# Altium schematic sheet 48V-12V20A.SchDoc
size 420 x 297 mm; SheetNumber: 1; SheetTotal: 1
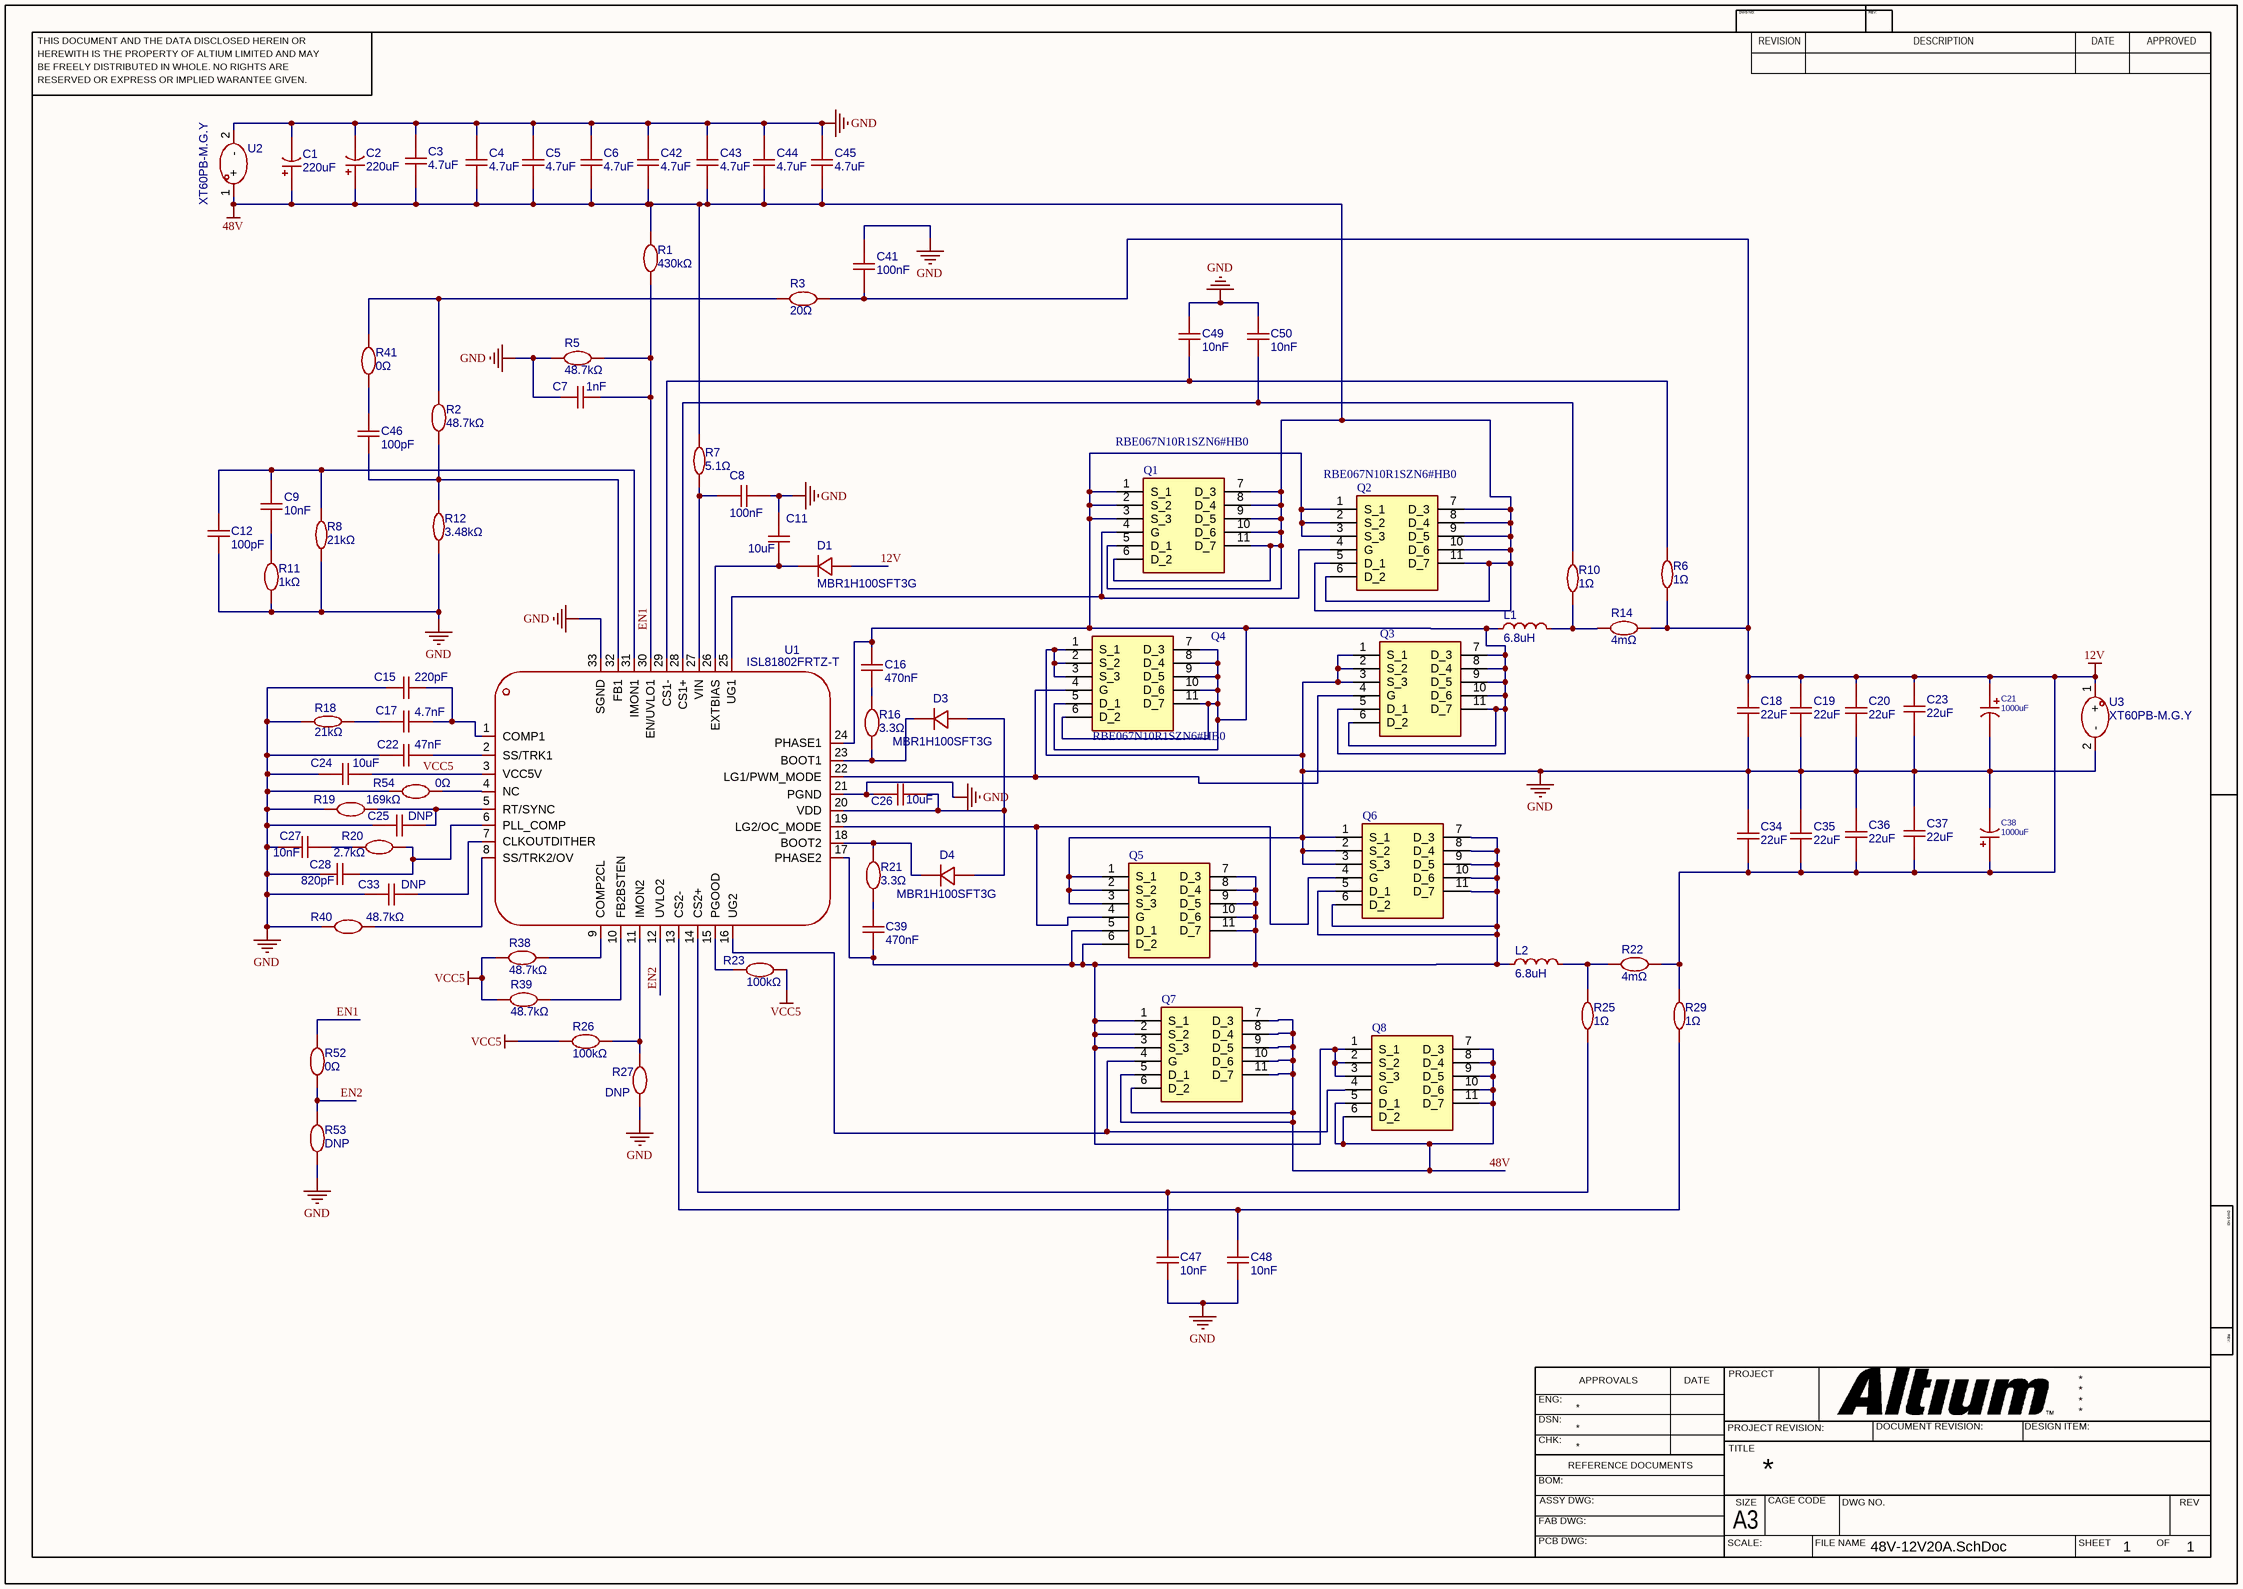
[diagram p0: 48V-12V20A.SchDoc]

## Parts
C1  220uF  [CAP-TH_BD12.5-P5.00-D0.6-FD]
C2  220uF  [CAP-TH_BD12.5-P5.00-D0.6-FD]
C3  4.7uF  [C1210]
C4  4.7uF  [C1210]
C5  4.7uF  [C1210]
C6  4.7uF  [C1210]
C7  1nF  [C0603]
C8  100nF  [C0402]
C9  10nF  [C0805]
C11  10uF  [C0805]
C12  100pF  [C0603]
C15  220pF  [C0402]
C16  470nF  [C0603]
C17  4.7nF  [C0402]
C18  22uF  [C1210]
C19  22uF  [C1210]
C20  22uF  [C1210]
C21  1000uF  [CAP-TH_BD8.0-P3.50-D0.6-FD-H17.0]
C22  47nF  [C0603]
C23  22uF  [C1210]
C24  10uF  [C1210]
C25  DNP  [C0603]
C26  10uF  [C0805]
C27  10nF  [C0805]
C28  820pF  [C0603]
C33  DNP  [C0603]
C34  22uF  [C1210]
C35  22uF  [C1210]
C36  22uF  [C1210]
C37  22uF  [C1210]
C38  1000uF  [CAP-TH_BD8.0-P3.50-D0.6-FD-H17.0]
C39  470nF  [C0603]
C41  100nF  [C0603]
C42  4.7uF  [C1210]
C43  4.7uF  [C1210]
C44  4.7uF  [C1210]
C45  4.7uF  [C1210]
C46  100pF  [C0603]
C47  10nF  [C0805]
C48  10nF  [C0805]
C49  10nF  [C0805]
C50  10nF  [C0805]
D1  MBR1H100SFT3G  [SOD-123F_L2.8-W1.8-LS3.7-RD]
D3  MBR1H100SFT3G  [SOD-123F_L2.8-W1.8-LS3.7-RD]
D4  MBR1H100SFT3G  [SOD-123F_L2.8-W1.8-LS3.7-RD]
L1  6.8uH  [IND-SMD_L12.8-W12.8-LS13.8_CYA1265]
L2  6.8uH  [IND-SMD_L12.8-W12.8-LS13.8_CYA1265]
Q1  RBE067N10R1SZN6#HB0  [RBA80N10EANS4UA07]
Q2  RBE067N10R1SZN6#HB0  [RBA80N10EANS4UA07]
Q3  RBE067N10R1SZN6#HB0  [RBA80N10EANS4UA07]  (value not drawn)
Q4  RBE067N10R1SZN6#HB0  [RBA80N10EANS4UA07]
Q5  RBE067N10R1SZN6#HB0  [RBA80N10EANS4UA07]  (value not drawn)
Q6  RBE067N10R1SZN6#HB0  [RBA80N10EANS4UA07]  (value not drawn)
Q7  RBE067N10R1SZN6#HB0  [RBA80N10EANS4UA07]  (value not drawn)
Q8  RBE067N10R1SZN6#HB0  [RBA80N10EANS4UA07]  (value not drawn)
R1  430kΩ  [R1206]
R2  48.7kΩ  [R0603]
R3  20Ω  [R0603]
R5  48.7kΩ  [R0603]
R6  1Ω  [R0603]
R7  5.1Ω  [R0603]
R8  21kΩ  [R0603]
R10  1Ω  [R0603]
R11  1kΩ  [R0603]
R12  3.48kΩ  [R0603]
R14  4mΩ  [RES-SMD_L6.4-W3.2_RLP25]
R16  3.3Ω  [R0603]
R18  21kΩ  [R0603]
R19  169kΩ  [R0603]
R20  2.7kΩ  [R0603]
R21  3.3Ω  [R0603]
R22  4mΩ  [RES-SMD_L6.4-W3.2_RLP25]
R23  100kΩ  [R0603]
R25  1Ω  [R0603]
R26  100kΩ  [R0603]
R27  DNP  [R0603]
R29  1Ω  [R0603]
R38  48.7kΩ  [R0603]
R39  48.7kΩ  [R0603]
R40  48.7kΩ  [R0603]
R41  0Ω  [R0402]
R52  0Ω  [R0402]
R53  DNP  [R0402]
R54  0Ω  [R0402]
U1  ISL81802FRTZ-T  [TQFN-32_L5.0-W5.0-P0.50-TL-EP3.5]
U2  XT60PB-M.G.Y  [CONN-TH_XT60PB-M]
U3  XT60PB-M.G.Y  [CONN-TH_XT60PB-M]

## Nets
12V: C18.2 C19.2 C20.2 C21.1 C23.2 C34.1 C35.1 C36.1 C37.1 C38.1 C41.1 D1.2(A) R3.2 R6.1 R14.2 R22.2 R29.2 U3.1(+)
48V: C1.1 C2.1 C3.1 C4.1 C5.1 C6.1 C42.1 C43.1 C44.1 C45.1 Q1.5(D_1) Q1.6(D_2) Q1.7(D_3) Q1.8(D_4) Q1.9(D_5) Q1.10(D_6) Q1.11(D_7) Q2.5(D_1) Q2.6(D_2) Q2.7(D_3) Q2.8(D_4) Q2.9(D_5) Q2.10(D_6) Q2.11(D_7) Q7.5(D_1) Q7.6(D_2) Q7.7(D_3) Q7.8(D_4) Q7.9(D_5) Q7.10(D_6) Q7.11(D_7) Q8.5(D_1) Q8.6(D_2) Q8.7(D_3) Q8.8(D_4) Q8.9(D_5) Q8.10(D_6) Q8.11(D_7) R1.2 R7.2 U2.1(+)
GND: C1.2 C2.2 C3.2 C4.2 C5.2 C6.2 C7.1 C8.2 C11.2 C12.1 C15.1 C18.1 C19.1 C20.1 C21.2 C22.2 C23.1 C24.1 C25.1 C26.2 C27.1 C28.1 C33.1 C34.2 C35.2 C36.2 C37.2 C38.2 C41.2 C42.2 C43.2 C44.2 C45.2 C47.1 C48.1 C49.2 C50.2 Q3.1(S_1) Q3.2(S_2) Q3.3(S_3) Q4.1(S_1) Q4.2(S_2) Q4.3(S_3) Q5.1(S_1) Q5.2(S_2) Q5.3(S_3) Q6.1(S_1) Q6.2(S_2) Q6.3(S_3) R5.1 R8.1 R11.1 R12.1 R18.1 R19.1 R27.2 R40.1 R53.1 R54.1 U1.21(PGND) U1.33(SGND) U2.2(-) U3.2(-)
VCC5: C24.2 R23.2 R26.1 R38.1 R39.1 U1.3(VCC5V)
EN1: C7.2 R1.1 R5.2 R52.2 U1.30(EN/UVLO1)
EN2: R52.1 R53.2 U1.12(UVLO2)
NetC8_1: C8.1 R7.1 U1.27(VIN)
NetC9_1: C9.1 R11.2
NetC9_2: C9.2 C12.2 R8.2 U1.31(IMON1)
NetC11_1: C11.1 D1.1(C) U1.26(EXTBIAS)
NetC15_2: C15.2 C17.2 U1.1(COMP1)
NetC16_1: C16.1 R16.2
NetC16_2: C16.2 L1.1 Q1.1(S_1) Q1.2(S_2) Q1.3(S_3) Q2.1(S_1) Q2.2(S_2) Q2.3(S_3) Q3.5(D_1) Q3.6(D_2) Q3.7(D_3) Q3.8(D_4) Q3.9(D_5) Q3.10(D_6) Q3.11(D_7) Q4.5(D_1) Q4.6(D_2) Q4.7(D_3) Q4.8(D_4) Q4.9(D_5) Q4.10(D_6) Q4.11(D_7) U1.24(PHASE1)
NetC17_1: C17.1 R18.2
NetC22_1: C22.1 U1.2(SS/TRK1)
NetC25_2: C25.2 R19.2 U1.5(RT/SYNC)
NetC26_1: C26.1 D3.2(A) D4.2(A) U1.20(VDD)
NetC27_2: C27.2 R20.1
NetC28_2: C28.2 R20.2 U1.6(PLL_COMP)
NetC33_2: C33.2 U1.7(CLKOUTDITHER)
NetC39_1: C39.1 L2.1 Q5.5(D_1) Q5.6(D_2) Q5.7(D_3) Q5.8(D_4) Q5.9(D_5) Q5.10(D_6) Q5.11(D_7) Q6.5(D_1) Q6.6(D_2) Q6.7(D_3) Q6.8(D_4) Q6.9(D_5) Q6.10(D_6) Q6.11(D_7) Q7.1(S_1) Q7.2(S_2) Q7.3(S_3) Q8.1(S_1) Q8.2(S_2) Q8.3(S_3) U1.17(PHASE2)
NetC39_2: C39.2 R21.1
NetC46_1: C46.1 R2.1 R12.2 U1.32(FB1)
NetC46_2: C46.2 R41.1
NetC47_2: C47.2 R25.1 U1.14(CS2+)
NetC48_2: C48.2 R29.1 U1.13(CS2-)
NetC49_1: C49.1 R6.2 U1.29(CS1-)
NetC50_1: C50.1 R10.2 U1.28(CS1+)
NetD3_1: D3.1(C) R16.1 U1.23(BOOT1)
NetD4_1: D4.1(C) R21.2 U1.18(BOOT2)
NetL1_2: L1.2 R10.1 R14.1
NetL2_2: L2.2 R22.1 R25.2
NetQ1_4: Q1.4(G) Q2.4(G) U1.25(UG1)
NetQ3_4: Q3.4(G) Q4.4(G) U1.22(LG1/PWM_MODE)
NetQ5_4: Q5.4(G) Q6.4(G) U1.19(LG2/OC_MODE)
NetQ7_4: Q7.4(G) Q8.4(G) U1.16(UG2)
NetR2_2: R2.2 R3.1 R41.2
NetR23_1: R23.1 U1.15(PGOOD)
NetR26_2: R26.2 R27.1 U1.11(IMON2)
NetR38_2: R38.2 U1.9(COMP2CL)
NetR39_2: R39.2 U1.10(FB2BSTEN)
NetR40_2: R40.2 U1.8(SS/TRK2/OV)
NetR54_2: R54.2 U1.4(NC)

## Notes on the sheet
- THIS DOCUMENT AND THE DATA DISCLOSED HEREIN OR
- HEREWITH IS THE PROPERTY OF ALTIUM LIMITED AND MAY
- DWG NO:
- REVISION
- REV:
- DESCRIPTION
- DATE
- APPROVED
- BE FREELY DISTRIBUTED IN WHOLE. NO RIGHTS ARE
- RESERVED OR EXPRESS OR IMPLIED WARANTEE GIVEN.
- ENG:
- APPROVALS
- PROJECT
- DSN:
- CHK:
- REFERENCE DOCUMENTS
- PROJECT REVISION:
- TITLE
- DOCUMENT REVISION:
- DESIGN ITEM:
- BOM:
- FAB DWG:
- PCB DWG:
- ASSY DWG:
- SCALE:
- A3
- SIZE
- CAGE CODE
- FILE NAME
- DWG NO.
- SHEET
- OF
- REV

## Library data of the parts
C1 C2 = EKZN101ELL221MK25S: 容值:220uF;精度:±20%;额定电压:100V;纹波电流:1.105A@120Hz;等效串联电阻(ESR):-;; Manufacturer: NCC(日本贵弥功); AddInBom: yes; ModelId: 968d8ff988964aab8919b46a6a737be2聨0819f05c4eef4c71ace90d822a990e87; ModelName: CAP-TH_D12.5-H20.0-P5.00; ModelTransform: 492.5187,492.11201,0,0,0,0,0,0,-137.795; Tolerance: ±20%; Voltage Rating: 100V; Pin Spacing: 5mm; Lifetime: 10000hrs@105℃; Symbol: EKZN101ELL221MK25S; Device: EKZN101ELL221MK25S; LCSC Part Name: 220uF ±20% 100V; SupplierPart: C2998532; ManufacturerPart: EKZN101ELL221MK25S; Supplier Footprint: 插件,D12.5xL25mm; JLCPCB Part Class: Extended Part; Datasheet: https://item.szlcsc.com/datasheet/EKZN101ELL221MK25S/3472715.html; Supplier: LCSC; ConvertToPcb: yes; FootprintName: CAP-TH_BD12.5-P5.00-D0.6-FD; Value: 220uF; Ripple Current: 1.105A@120Hz; Equivalent Series Resistance(ESR): -; Diameter: 12.5mm; Height - Seated (Max): 25mm; Operating Temperature: -40℃~+105℃
C3-C6 C42-C45 = GCM32DC72A475KE02L: 容值:4.7uF;精度:±10%;额定电压:100V;温度系数:X7S;; Manufacturer: muRata(村田); AddInBom: yes; ModelId: 833068e7fe044595a6eec77c56179455聨0819f05c4eef4c71ace90d822a990e87; ModelName: C1210_L3.2-W2.5-H2.5; ModelTransform: 125.984,98.425,0,0,0,0,0,0,0; Tolerance: ±10%; Voltage Rating: 100V; Temperature Coefficient: X7S; Symbol: GCM32DC72A475KE02L; Device: GCM32DC72A475KE02L; LCSC Part Name: 4.7uF ±10% 100V; SupplierPart: C913445; ManufacturerPart: GCM32DC72A475KE02L; Supplier Footprint: 1210; JLCPCB Part Class: Extended Part; Datasheet: https://item.szlcsc.com/datasheet/GCM32DC72A475KE02L/983764.html; Supplier: LCSC; ConvertToPcb: yes; FootprintName: C1210; Value: 4.7uF
C7 = CC0603KRX7R9BB102: 容值:1nF;精度:±10%;额定电压:50V;材质(温度系数):X7R;; Manufacturer: YAGEO(国巨); AddInBom: yes; ModelId: ac125912035d415993ca9572d50418b1聨0819f05c4eef4c71ace90d822a990e87; ModelName: C0603_L1.6-W0.8-H0.8; ModelTransform: 62.992,31.496,0,0,0,0,0,0,0; Tolerance: ±10%; Voltage Rated: 50V; Temperature Coefficient: X7R; Symbol: CC0603KRX7R9BB102; Device: CC0603KRX7R9BB102; LCSC Part Name: 1nF ±10% 50V; SupplierPart: C100040; ManufacturerPart: CC0603KRX7R9BB102; Supplier Footprint: 0603; JLCPCB Part Class: Extended Part; Datasheet: https://atta.szlcsc.com/upload/public/pdf/source/20180910/C282072_33301C7F631E79921B82A8DAC6BCC5B3.pdf; Supplier: LCSC; ConvertToPcb: yes; FootprintName: C0603; Value: 1nF
C8 = CGA0402X5R104K101GT: 容值:100nF;精度:±10%;额定电压:100V;温度系数:X5R;; Manufacturer: HRE(芯声); AddInBom: yes; ModelId: 36a51122f27c49738f86b3bfa98863e0聨0819f05c4eef4c71ace90d822a990e87; ModelName: C0402_L1.0-W0.5-H0.5; ModelTransform: 39.37,19.685,0,0,0,0,0,0,0; Tolerance: ±10%; Voltage Rating: 100V; Temperature Coefficient: X5R; Symbol: CGA0402X5R104K101GT; Device: CGA0402X5R104K101GT; LCSC Part Name: 100nF ±10% 100V; SupplierPart: C49056139; ManufacturerPart: CGA0402X5R104K101GT; Supplier Footprint: 0402; JLCPCB Part Class: Extended Part; Datasheet: https://item.szlcsc.com/datasheet/CGA0402X5R104K101GT/51423913.html; Supplier: LCSC; ConvertToPcb: yes; FootprintName: C0402; Value: 100nF
C9 C27 = GRM2195C1H103FA01D: 容值:10nF;精度:±1%;额定电压:50V;材质(温度系数):C0G;; Manufacturer: muRata(村田); AddInBom: yes; ModelId: 1ba041120af144c991958decab20d241聨0819f05c4eef4c71ace90d822a990e87; ModelName: C0805_L2.0-W1.3-H1.3; ModelTransform: 78.74,51.181,0,0,0,0,0,0.0005,0; Tolerance: ±1%; Voltage Rated: 50V; Temperature Coefficient: C0G; Symbol: GRM2195C1H103FA01D; Device: GRM2195C1H103FA01D; LCSC Part Name: 10nF ±1% 50V; SupplierPart: C441760; ManufacturerPart: GRM2195C1H103FA01D; Supplier Footprint: 0805; JLCPCB Part Class: Extended Part; Datasheet: https://atta.szlcsc.com/upload/public/pdf/source/20200305/C490387_23319AE8C154DEB24C505E6C82A8106A.pdf; Supplier: LCSC; ConvertToPcb: yes; FootprintName: C0805; Value: 10nF
C11 = HGC0805R5106K500NSLJ: 容值:10uF;精度:±10%;额定电压:50V;温度系数:X5R;; Manufacturer: Chinocera(华瓷); AddInBom: yes; ModelId: 1ba041120af144c991958decab20d241聨0819f05c4eef4c71ace90d822a990e87; ModelName: C0805_L2.0-W1.3-H1.3; ModelTransform: 78.74,51.181,0,0,0,0,0,0.0005,0; Tolerance: ±10%; Voltage Rating: 50V; Temperature Coefficient: X5R; Symbol: HGC0805R5106K500NSLJ; Device: HGC0805R5106K500NSLJ; LCSC Part Name: 10uF ±10% 50V; SupplierPart: C22367830; ManufacturerPart: HGC0805R5106K500NSLJ; Supplier Footprint: 0805; JLCPCB Part Class: Extended Part; Datasheet: https://item.szlcsc.com/datasheet/HGC0805R5106K500NSLJ/23841135.html; Supplier: LCSC; ConvertToPcb: yes; FootprintName: C0805; Value: 10uF
C12 C46 = CC0603JRNPO0BN101: 容值:100pF;精度:±5%;额定电压:100V;温度系数:NP0;; Manufacturer: YAGEO(国巨); AddInBom: yes; ModelId: ac125912035d415993ca9572d50418b1聨0819f05c4eef4c71ace90d822a990e87; ModelName: C0603_L1.6-W0.8-H0.8; ModelTransform: 62.992,31.496,0,0,0,0,0,0,0; Tolerance: ±5%; Voltage Rating: 100V; Temperature Coefficient: NP0; Symbol: CC0603JRNPO0BN101; Device: CC0603JRNPO0BN101; LCSC Part Name: 100pF ±5% 100V; SupplierPart: C107033; ManufacturerPart: CC0603JRNPO0BN101; Supplier Footprint: 0603; JLCPCB Part Class: Extended Part; Datasheet: https://item.szlcsc.com/datasheet/CC0603JRNPO0BN101/108249.html; Supplier: LCSC; ConvertToPcb: yes; FootprintName: C0603; Value: 100pF
C15 = 0402B221K500NT: 容值:220pF;精度:±10%;额定电压:50V;温度系数:X7R;; Manufacturer: FH(风华); AddInBom: yes; ModelId: 36a51122f27c49738f86b3bfa98863e0聨0819f05c4eef4c71ace90d822a990e87; ModelName: C0402_L1.0-W0.5-H0.5; ModelTransform: 39.37,19.685,0,0,0,0,0,0,0; Tolerance: ±10%; Voltage Rating: 50V; Temperature Coefficient: X7R; Symbol: 0402B221K500NT; Device: 0402B221K500NT; LCSC Part Name: 220pF ±10% 50V; SupplierPart: C1530; ManufacturerPart: 0402B221K500NT; Supplier Footprint: 0402; JLCPCB Part Class: Basic Part; Datasheet: https://item.szlcsc.com/datasheet/0402B221K500NT/1882.html; Supplier: LCSC; ConvertToPcb: yes; FootprintName: C0402; Value: 220pF
C16 C39 = GRM188R71E474KA12D: 容值:470nF;精度:±10%;额定电压:25V;温度系数:X7R;; Manufacturer: muRata(村田); AddInBom: yes; ModelId: ac125912035d415993ca9572d50418b1聨0819f05c4eef4c71ace90d822a990e87; ModelName: C0603_L1.6-W0.8-H0.8; ModelTransform: 62.992,31.496,0,0,0,0,0,0,0; Tolerance: ±10%; Voltage Rating: 25V; Temperature Coefficient: X7R; Symbol: GRM188R71E474KA12D; Device: GRM188R71E474KA12D; LCSC Part Name: 470nF ±10% 25V; SupplierPart: C77052; ManufacturerPart: GRM188R71E474KA12D; Supplier Footprint: 0603; JLCPCB Part Class: Extended Part; Datasheet: https://item.szlcsc.com/datasheet/GRM188R71E474KA12D/78179.html; Supplier: LCSC; ConvertToPcb: yes; FootprintName: C0603; Value: 470nF
C17 = GRM1555C1H472JE01D: 容值:4.7nF;精度:±5%;额定电压:50V;温度系数:C0G;; Manufacturer: muRata(村田); AddInBom: yes; ModelId: 36a51122f27c49738f86b3bfa98863e0聨0819f05c4eef4c71ace90d822a990e87; ModelName: C0402_L1.0-W0.5-H0.5; ModelTransform: 39.37,19.685,0,0,0,0,0,0,0; Tolerance: ±5%; Voltage Rating: 50V; Temperature Coefficient: C0G; Symbol: GRM1555C1H472JE01D; Device: GRM1555C1H472JE01D; LCSC Part Name: 4.7nF ±5% 50V; SupplierPart: C1518204; ManufacturerPart: GRM1555C1H472JE01D; Supplier Footprint: 0402; JLCPCB Part Class: Extended Part; Datasheet: https://item.szlcsc.com/datasheet/GRM1555C1H472JE01D/1609001.html; Supplier: LCSC; ConvertToPcb: yes; FootprintName: C0402; Value: 4.7nF
C18-C20 C23 C34-C37 = GRM32ER71E226KE15L: 容值:22uF;精度:±10%;额定电压:25V;温度系数:X7R;; Manufacturer: muRata(村田); AddInBom: yes; ModelId: 833068e7fe044595a6eec77c56179455聨0819f05c4eef4c71ace90d822a990e87; ModelName: C1210_L3.2-W2.5-H2.5; ModelTransform: 125.984,98.425,0,0,0,0,0,0,0; Tolerance: ±10%; Voltage Rating: 25V; Temperature Coefficient: X7R; Symbol: GRM32ER71E226KE15L; Device: GRM32ER71E226KE15L; LCSC Part Name: 22uF ±10% 25V; SupplierPart: C21397; ManufacturerPart: GRM32ER71E226KE15L; Supplier Footprint: 1210; JLCPCB Part Class: Extended Part; Datasheet: https://item.szlcsc.com/datasheet/GRM32ER71E226KE15L/22114.html; Supplier: LCSC; ConvertToPcb: yes; FootprintName: C1210; Value: 22uF
C21 C38 = PB25V1000M8X17: 容值:1000uF;精度:±20%;额定电压:25V;纹波电流:4.5A@100kHz;等效串联电阻(ESR):16mΩ@100kHz;类型:聚合物;; Manufacturer: JIERR(捷而瑞); AddInBom: yes; ModelId: 8dbab90daa9543b98cbad4b58849852c聨0819f05c4eef4c71ace90d822a990e87; ModelTransform: 314.96,314.99465,0,0,0,0,0,0,-196.85; Tolerance: ±20%; Voltage Rating: 25V; Type: 聚合物; Pin Spacing: 3.5mm; Lifetime: 5000hrs@105℃; Symbol: PB25V1000M8X17; Device: PB25V1000M8X17; LCSC Part Name: 1000uF ±20% 25V; SupplierPart: C51934175; ManufacturerPart: PB25V1000M8X17; Supplier Footprint: 插件,D8xL17mm; JLCPCB Part Class: Extended Part; Datasheet: https://item.szlcsc.com/datasheet/PB25V1000M8X17/54649587.html; Supplier: LCSC; ConvertToPcb: yes; FootprintName: CAP-TH_BD8.0-P3.50-D0.6-FD-H17.0; ModelName: CAP-TH_BD8.0-P3.50-D0.6-FD-H17.0; Value: 1000uF; Ripple Current: 4.5A@100kHz; Equivalent Series Resistance(ESR): 16mΩ@100kHz; Diameter: 8mm; Height - Seated (Max): 17mm; Operating Temperature: -55℃~+105℃
C22 = CC0603KRX7R8BB473: 容值:47nF;精度:±10%;额定电压:25V;温度系数:X7R;; Manufacturer: YAGEO(国巨); AddInBom: yes; ModelId: ac125912035d415993ca9572d50418b1聨0819f05c4eef4c71ace90d822a990e87; ModelName: C0603_L1.6-W0.8-H0.8; ModelTransform: 62.992,31.496,0,0,0,0,0,0,0; Tolerance: ±10%; Voltage Rating: 25V; Temperature Coefficient: X7R; Symbol: CC0603KRX7R8BB473; Device: CC0603KRX7R8BB473; LCSC Part Name: 47nF ±10% 25V; SupplierPart: C113811; ManufacturerPart: CC0603KRX7R8BB473; Supplier Footprint: 0603; JLCPCB Part Class: Extended Part; Datasheet: https://item.szlcsc.com/datasheet/CC0603KRX7R8BB473/115047.html; Supplier: LCSC; ConvertToPcb: yes; FootprintName: C0603; Value: 47nF
C24 = FS32X106K101EGG: 容值:10uF;精度:±10%;额定电压:100V;温度系数:X7R;; Manufacturer: PSA(信昌电陶); AddInBom: yes; ModelId: 833068e7fe044595a6eec77c56179455聨0819f05c4eef4c71ace90d822a990e87; ModelName: C1210_L3.2-W2.5-H2.5; ModelTransform: 125.984,98.425,0,0,0,0,0,0,0; Tolerance: ±10%; Voltage Rating: 100V; Temperature Coefficient: X7R; Symbol: FS32X106K101EGG; Device: FS32X106K101EGG; LCSC Part Name: 10uF ±10% 100V; SupplierPart: C5156756; ManufacturerPart: FS32X106K101EGG; Supplier Footprint: 1210; JLCPCB Part Class: Extended Part; Datasheet: https://item.szlcsc.com/datasheet/FS32X106K101EGG/5791227.html; Supplier: LCSC; ConvertToPcb: yes; FootprintName: C1210; Value: 10uF
C25 C33 = CC0603KRX7R8BB471: 容值:470pF;精度:±10%;额定电压:25V;温度系数:X7R;; Manufacturer: YAGEO(国巨); AddInBom: yes; ModelId: ac125912035d415993ca9572d50418b1聨0819f05c4eef4c71ace90d822a990e87; ModelName: C0603_L1.6-W0.8-H0.8; ModelTransform: 62.992,31.496,0,0,0,0,0,0,0; Value: 470pF; Tolerance: ±10%; Voltage Rating: 25V; Temperature Coefficient: X7R; Symbol: CC0603KRX7R8BB471; Device: CC0603KRX7R8BB471; LCSC Part Name: 470pF ±10% 25V; SupplierPart: C519413; ManufacturerPart: CC0603KRX7R8BB471; Supplier Footprint: 0603; JLCPCB Part Class: Extended Part; Datasheet: https://item.szlcsc.com/datasheet/CC0603KRX7R8BB471/536084.html; Supplier: LCSC; ConvertToPcb: yes; FootprintName: C0603
C26 = GRM21BC71C106KE11L: 容值:10uF;精度:±10%;额定电压:16V;温度系数:X7S;; Manufacturer: muRata(村田); AddInBom: yes; ModelId: 1ba041120af144c991958decab20d241聨0819f05c4eef4c71ace90d822a990e87; ModelName: C0805_L2.0-W1.3-H1.3; ModelTransform: 78.74,51.181,0,0,0,0,0,0.0005,0; Tolerance: ±10%; Voltage Rating: 16V; Temperature Coefficient: X7S; Symbol: GRM21BC71C106KE11L; Device: GRM21BC71C106KE11L; LCSC Part Name: 10uF ±10% 16V; SupplierPart: C162319; ManufacturerPart: GRM21BC71C106KE11L; Supplier Footprint: 0805; JLCPCB Part Class: Extended Part; Datasheet: https://item.szlcsc.com/datasheet/GRM21BC71C106KE11L/173700.html; Supplier: LCSC; ConvertToPcb: yes; FootprintName: C0805; Value: 10uF
C28 = 0603B821K500NT: 容值:820pF;精度:±10%;额定电压:50V;温度系数:X7R;; Manufacturer: FH(风华); AddInBom: yes; ModelId: ac125912035d415993ca9572d50418b1聨0819f05c4eef4c71ace90d822a990e87; ModelName: C0603_L1.6-W0.8-H0.8; ModelTransform: 62.992,31.496,0,0,0,0,0,0,0; Tolerance: ±10%; Voltage Rating: 50V; Temperature Coefficient: X7R; Symbol: 0603B821K500NT; Device: 0603B821K500NT; LCSC Part Name: 820pF ±10% 50V; SupplierPart: C1632; ManufacturerPart: 0603B821K500NT; Supplier Footprint: 0603; JLCPCB Part Class: Extended Part; Datasheet: https://item.szlcsc.com/datasheet/0603B821K500NT/1984.html; Supplier: LCSC; ConvertToPcb: yes; FootprintName: C0603; Value: 820pF
C41 = CL10B104KC8NNNC: 容值:100nF;精度:±10%;额定电压:100V;温度系数:X7R;; Manufacturer: SAMSUNG(三星); AddInBom: yes; ModelId: ac125912035d415993ca9572d50418b1聨0819f05c4eef4c71ace90d822a990e87; ModelName: C0603_L1.6-W0.8-H0.8; ModelTransform: 62.992,31.496,0,0,0,0,0,0,0; Tolerance: ±10%; Voltage Rating: 100V; Temperature Coefficient: X7R; Symbol: CL10B104KC8NNNC; Device: CL10B104KC8NNNC; LCSC Part Name: 100nF ±10% 100V; SupplierPart: C15725; ManufacturerPart: CL10B104KC8NNNC; Supplier Footprint: 0603; JLCPCB Part Class: Extended Part; Datasheet: https://item.szlcsc.com/datasheet/CL10B104KC8NNNC/16407.html; Supplier: LCSC; ConvertToPcb: yes; FootprintName: C0603; Value: 100nF
C47-C50 = CL21B103KCANNNC: 容值:10nF;精度:±10%;额定电压:100V;温度系数:X7R;; Manufacturer: SAMSUNG(三星); AddInBom: yes; ModelId: 1ba041120af144c991958decab20d241聨0819f05c4eef4c71ace90d822a990e87; ModelName: C0805_L2.0-W1.3-H1.3; ModelTransform: 78.74,51.181,0,0,0,0,0,0.0005,0; Tolerance: ±10%; Voltage Rating: 100V; Temperature Coefficient: X7R; Symbol: CL21B103KCANNNC; Device: CL21B103KCANNNC; LCSC Part Name: 10nF ±10% 100V; SupplierPart: C18741; ManufacturerPart: CL21B103KCANNNC; Supplier Footprint: 0805; JLCPCB Part Class: Extended Part; Datasheet: https://item.szlcsc.com/datasheet/CL21B103KCANNNC/19444.html; Supplier: LCSC; ConvertToPcb: yes; FootprintName: C0805; Value: 10nF
D1 D3 D4 = MBR1H100SFT3G: 正向压降(Vf):760mV@1A;直流反向耐压(Vr):100V;整流电流:1A;; Manufacturer: onsemi(安森美); AddInBom: yes; ModelId: 321bc188a2eb4b418ce08d06d1c3a1f1聨0819f05c4eef4c71ace90d822a990e87; ModelName: SOD-123FL_L2.8-W1.8-LS3.7-RD-1; ModelTransform: 145.669,70.866,0,0,0,0,0,0.276,0; Voltage - DC Reverse(Vr): 100V; Current - Rectified: 1A; Reverse Leakage Current (Ir): 40uA@100V; Operating Junction Temperature Range: -65℃~+175℃; Non-Repetitive Peak Forward Surge Current: 50A; Symbol: MBR1H100SFT3G; Device: MBR1H100SFT3G; LCSC Part Name: 电压:100V 电流:1A; SupplierPart: C235757; ManufacturerPart: MBR1H100SFT3G; Supplier Footprint: SOD-123FL; JLCPCB Part Class: Extended Part; Datasheet: https://item.szlcsc.com/datasheet/MBR1H100SFT3G/235575.html; Supplier: LCSC; ConvertToPcb: yes; FootprintName: SOD-123F_L2.8-W1.8-LS3.7-RD; Voltage - Forward(Vf@If): 760mV@1A
L1 L2 = CYA1265-6.8UH: 电感值:6.8uH;精度:±20%;额定电流:15A;饱和电流(Isat):28A;类型:一体成型电感;; Manufacturer: SHOU HAN(首韩); AddInBom: yes; ModelId: f7b33e13773b407da2951f533edd9b8a聨0819f05c4eef4c71ace90d822a990e87; ModelTransform: 543.306,504.3297,0,0,0,0,0,0,0; Tolerance: ±20%; Current Rating: 15A; Current - Saturation(Isat): 28A; Type: 一体成型电感; Symbol: CYA1265-6.8UH; Device: CYA1265-6.8UH; LCSC Part Name: 6.8uH ±20% 28A; SupplierPart: C19268667; ManufacturerPart: CYA1265-6.8UH; Supplier Footprint: SMD,13.8x12.8mm; JLCPCB Part Class: Extended Part; Datasheet: https://item.szlcsc.com/datasheet/CYA1265-6.8UH/20528550.html; Supplier: LCSC; ConvertToPcb: yes; FootprintName: IND-SMD_L12.8-W12.8-LS13.8_CYA1265; ModelName: IND-SMD_L12.8-W12.8-LS13.8_CYA1265; Value: 6.8uH; DC Resistance(DCR): -
Q1-Q8 = RBE067N10R1SZN6#HB0: MOSFET (N-Channel); Manufacturer_Name: Renesas Electronics; Datasheet Link: https://www.renesas.com/en/products/rbe067n10r1szn6/part-details/rbe067n10r1szn6-hb0; Manufacturer_Part_Number: RBE067N10R1SZN6#HB0
R1 = FRC1206F4303TS: 电阻类型:厚膜电阻;阻值:430kΩ;精度:±1%;功率:250mW;工作电压:200V;温度系数:±100ppm/℃;; Manufacturer: FOJAN(富捷); AddInBom: yes; ModelId: 89a1f13db2384da588040e0b3c55bf66聨0819f05c4eef4c71ace90d822a990e87; ModelName: R1206_L3.2-W1.6-H0.6; ModelTransform: 125.984,62.992,0,0,0,0,0,0,0; Tolerance: ±1%; Power(Watts): 250mW; Voltage-Supply(Max): 200V; Symbol: FRC1206F4303  TS; Device: FRC1206F4303TS; LCSC Part Name: 430kΩ ±1% 250mW 厚膜电阻; SupplierPart: C2930429; ManufacturerPart: FRC1206F4303TS; Supplier Footprint: 1206; JLCPCB Part Class: Extended Part; Supplier: LCSC; ConvertToPcb: yes; FootprintName: R1206; Type: 厚膜电阻; Value: 430kΩ; Temperature Coefficient: ±100ppm/℃; Operating Temperature: -55℃~+155℃
R2 R5 R38-R40 = FRC0603F4872TS: 电阻类型:厚膜电阻;阻值:48.7kΩ;精度:±1%;功率:100mW;工作电压:75V;温度系数:±100ppm/℃;; Manufacturer: FOJAN(富捷); AddInBom: yes; ModelId: fc143cca1e79419f9cd78b61e9279f08聨0819f05c4eef4c71ace90d822a990e87; ModelTransform: 31.8897,63.7794,0,90,0,0,0,0,0; Tolerance: ±1%; Power(Watts): 100mW; Voltage-Supply(Max): 75V; Symbol: FRC0603F4872TS; Device: FRC0603F4872TS; LCSC Part Name: 48.7kΩ ±1% 100mW 厚膜电阻; SupplierPart: C2933226; ManufacturerPart: FRC0603F4872TS; Supplier Footprint: 0603; JLCPCB Part Class: Extended Part; Datasheet: https://item.szlcsc.com/datasheet/FRC0603F4872TS/3279328.html; Supplier: LCSC; ConvertToPcb: yes; FootprintName: R0603; ModelName: R0603; Type: 厚膜电阻; Value: 48.7kΩ; Temperature Coefficient: ±100ppm/℃; Operating Temperature: -55℃~+155℃
R3 = FRC0603F20R0TS: 电阻类型:厚膜电阻;阻值:20Ω;精度:±1%;功率:100mW;工作电压:75V;温度系数:±100ppm/℃;; Manufacturer: FOJAN(富捷); AddInBom: yes; ModelId: fc143cca1e79419f9cd78b61e9279f08聨0819f05c4eef4c71ace90d822a990e87; ModelTransform: 31.8897,63.7794,0,90,0,0,0,0,0; Tolerance: ±1%; Power(Watts): 100mW; Voltage-Supply(Max): 75V; Symbol: FRC0603F20R0TS; Device: FRC0603F20R0TS; LCSC Part Name: 20Ω ±1% 100mW 厚膜电阻; SupplierPart: C2907012; ManufacturerPart: FRC0603F20R0TS; Supplier Footprint: 0603; JLCPCB Part Class: Extended Part; Supplier: LCSC; ConvertToPcb: yes; FootprintName: R0603; ModelName: R0603; Type: 厚膜电阻; Value: 20Ω; Temperature Coefficient: ±100ppm/℃; Operating Temperature: -55℃~+155℃
R6 R10 R25 R29 = AC0603FR-071RL: 电阻类型:厚膜电阻;阻值:1Ω;精度:±1%;功率:100mW;工作电压:75V;温度系数:±200ppm/℃;; Manufacturer: YAGEO(国巨); AddInBom: yes; ModelId: fc143cca1e79419f9cd78b61e9279f08聨0819f05c4eef4c71ace90d822a990e87; ModelTransform: 31.8897,63.7794,0,90,0,0,0,0,0; Tolerance: ±1%; Power(Watts): 100mW; Voltage-Supply(Max): 75V; Symbol: AC0603FR-071RL; Device: AC0603FR-071RL; LCSC Part Name: 厚膜电阻 1Ω ±1% 100mW; SupplierPart: C144684; ManufacturerPart: AC0603FR-071RL; Supplier Footprint: 0603; JLCPCB Part Class: Extended Part; Datasheet: https://item.szlcsc.com/datasheet/AC0603FR-071RL/156016.html; Supplier: LCSC; ConvertToPcb: yes; FootprintName: R0603; ModelName: R0603; Type: 厚膜电阻; Value: 1Ω; Temperature Coefficient: ±200ppm/℃; Operating Temperature: -55℃~+155℃
R7 = RC0603FR-075R1L: 电阻类型:厚膜电阻;阻值:5.1Ω;精度:±1%;功率:100mW;最大工作电压:75V;温度系数:±200ppm/℃;; Manufacturer: YAGEO(国巨); AddInBom: yes; ModelId: fc143cca1e79419f9cd78b61e9279f08聨0819f05c4eef4c71ace90d822a990e87; ModelTransform: 31.8897,63.7794,0,90,0,0,0,0,0; Tolerance: ±1%; Power(Watts): 100mW; Overload Voltage (Max): 75V; Symbol: RC0603FR-075R1L; Device: RC0603FR-075R1L; LCSC Part Name: 厚膜电阻 5.1Ω ±1% 100mW; SupplierPart: C114626; ManufacturerPart: RC0603FR-075R1L; Supplier Footprint: 0603; JLCPCB Part Class: Extended Part; Datasheet: https://atta.szlcsc.com/upload/public/pdf/source/20180821/C275644_0D56F95EFF785E7D9A1FEF436B37DA78.pdf; Supplier: LCSC; ConvertToPcb: yes; FootprintName: R0603; ModelName: R0603; Type: 厚膜电阻; Value: 5.1Ω; Temperature Coefficient: ±200ppm/℃; Operating Temperature Range: -55℃~+155℃
R8 R18 = 0603WAF2102T5E: 电阻类型:厚膜电阻;阻值:21kΩ;精度:±1%;功率:100mW;工作电压:75V;温度系数:±100ppm/℃;; Manufacturer: UNI-ROYAL(厚声); AddInBom: yes; ModelId: fc143cca1e79419f9cd78b61e9279f08聨0819f05c4eef4c71ace90d822a990e87; ModelTransform: 31.8897,63.7794,0,90,0,0,0,0,0; Tolerance: ±1%; Power(Watts): 100mW; Voltage-Supply(Max): 75V; Symbol: 0603WAF2102T5E; Device: 0603WAF2102T5E; LCSC Part Name: 21kΩ ±1% 100mW 厚膜电阻; SupplierPart: C22956; ManufacturerPart: 0603WAF2102T5E; Supplier Footprint: 0603; JLCPCB Part Class: Extended Part; Datasheet: https://item.szlcsc.com/datasheet/0603WAF2102T5E/23683.html; Supplier: LCSC; ConvertToPcb: yes; FootprintName: R0603; ModelName: R0603; Type: 厚膜电阻; Value: 21kΩ; Temperature Coefficient: ±100ppm/℃; Operating Temperature: -55℃~+155℃
R11 = FRC0603F1001TS: 电阻类型:厚膜电阻;阻值:1kΩ;精度:±1%;功率:100mW;工作电压:75V;温度系数:±100ppm/℃;; Manufacturer: FOJAN(富捷); AddInBom: yes; ModelId: fc143cca1e79419f9cd78b61e9279f08聨0819f05c4eef4c71ace90d822a990e87; ModelTransform: 31.8897,63.7794,0,90,0,0,0,0,0; Tolerance: ±1%; Power(Watts): 100mW; Voltage-Supply(Max): 75V; Symbol: FRC0603F1001TS; Device: FRC0603F1001TS; LCSC Part Name: 1kΩ ±1% 100mW 厚膜电阻; SupplierPart: C2907002; ManufacturerPart: FRC0603F1001TS; Supplier Footprint: 0603; JLCPCB Part Class: Extended Part; Datasheet: https://item.szlcsc.com/datasheet/FRC0603F1001TS/3180515.html; Supplier: LCSC; ConvertToPcb: yes; FootprintName: R0603; ModelName: R0603; Type: 厚膜电阻; Value: 1kΩ; Temperature Coefficient: ±100ppm/℃; Operating Temperature: -55℃~+155℃
R12 = 0603WAF3481T5E: 电阻类型:厚膜电阻;阻值:3.48kΩ;精度:±1%;功率:100mW;工作电压:75V;温度系数:±100ppm/℃;; Manufacturer: UNI-ROYAL(厚声); AddInBom: yes; ModelId: fc143cca1e79419f9cd78b61e9279f08聨0819f05c4eef4c71ace90d822a990e87; ModelTransform: 31.8897,63.7794,0,90,0,0,0,0,0; Tolerance: ±1%; Power(Watts): 100mW; Voltage-Supply(Max): 75V; Symbol: 0603WAF3481T5E; Device: 0603WAF3481T5E; LCSC Part Name: 3.48kΩ ±1% 100mW 厚膜电阻; SupplierPart: C22996; ManufacturerPart: 0603WAF3481T5E; Supplier Footprint: 0603; JLCPCB Part Class: Extended Part; Datasheet: https://item.szlcsc.com/datasheet/0603WAF3481T5E/23723.html; Supplier: LCSC; ConvertToPcb: yes; FootprintName: R0603; ModelName: R0603; Type: 厚膜电阻; Value: 3.48kΩ; Temperature Coefficient: ±100ppm/℃; Operating Temperature: -55℃~+155℃
R14 R22 = FPM253WFR004TML: 电阻类型:采样电阻;阻值:4mΩ;精度:±1%;功率:3W;温度系数:±50ppm/℃;安装方式:贴片;; Manufacturer: FOJAN(富捷); AddInBom: yes; ModelId: 33857086d8cb41db859131c51044579d聨0819f05c4eef4c71ace90d822a990e87; ModelName: RES-SMD_L6.4-W3.2-H0.7; ModelTransform: 251.968,125.984,0,0,0,0,0,0,0; Tolerance: ±1%; Power(Watts): 3W; Symbol: FPM253WFR004TML; Device: FPM253WFR004TML; LCSC Part Name: 4mΩ ±1% 3W 合金电阻; SupplierPart: C7420018; ManufacturerPart: FPM253WFR004TML; Supplier Footprint: 2512; JLCPCB Part Class: Extended Part; Datasheet: https://item.szlcsc.com/datasheet/FPM253WFR004TML/8395311.html; Supplier: LCSC; ConvertToPcb: yes; FootprintName: RES-SMD_L6.4-W3.2_RLP25; Type: 采样电阻; Value: 4mΩ; Temperature Coefficient: ±50ppm/℃; Mounting Type: 贴片
R16 R21 = FRC0603F3R30TS: 电阻类型:厚膜电阻;阻值:3.3Ω;精度:±1%;功率:100mW;工作电压:75V;温度系数:±200ppm/℃;; Manufacturer: FOJAN(富捷); AddInBom: yes; ModelId: fc143cca1e79419f9cd78b61e9279f08聨0819f05c4eef4c71ace90d822a990e87; ModelTransform: 31.8897,63.7794,0,90,0,0,0,0,0; Tolerance: ±1%; Power(Watts): 100mW; Voltage-Supply(Max): 75V; Symbol: FRC0603F3R30TS; Device: FRC0603F3R30TS; LCSC Part Name: 3.3Ω ±1% 100mW 厚膜电阻; SupplierPart: C2930016; ManufacturerPart: FRC0603F3R30TS; Supplier Footprint: 0603; JLCPCB Part Class: Extended Part; Supplier: LCSC; ConvertToPcb: yes; FootprintName: R0603; ModelName: R0603; Type: 厚膜电阻; Value: 3.3Ω; Temperature Coefficient: ±200ppm/℃; Operating Temperature: -55℃~+155℃
R19 = FRC0603F1693TS: 电阻类型:厚膜电阻;阻值:169kΩ;精度:±1%;功率:100mW;工作电压:75V;温度系数:±100ppm/℃;; Manufacturer: FOJAN(富捷); AddInBom: yes; ModelId: fc143cca1e79419f9cd78b61e9279f08聨0819f05c4eef4c71ace90d822a990e87; ModelTransform: 31.8897,63.7794,0,90,0,0,0,0,0; Tolerance: ±1%; Power(Watts): 100mW; Voltage-Supply(Max): 75V; Symbol: FRC0603F1693TS; Device: FRC0603F1693TS; LCSC Part Name: 169kΩ ±1% 100mW 厚膜电阻; SupplierPart: C3013192; ManufacturerPart: FRC0603F1693TS; Supplier Footprint: 0603; JLCPCB Part Class: Extended Part; Datasheet: https://item.szlcsc.com/datasheet/FRC0603F1693TS/3519476.html; Supplier: LCSC; ConvertToPcb: yes; FootprintName: R0603; ModelName: R0603; Type: 厚膜电阻; Value: 169kΩ; Temperature Coefficient: ±100ppm/℃; Operating Temperature: -55℃~+155℃
R20 = FRC0603F2701TS: 电阻类型:厚膜电阻;阻值:2.7kΩ;精度:±1%;功率:100mW;工作电压:75V;温度系数:±100ppm/℃;; Manufacturer: FOJAN(富捷); AddInBom: yes; ModelId: fc143cca1e79419f9cd78b61e9279f08聨0819f05c4eef4c71ace90d822a990e87; ModelTransform: 31.8897,63.7794,0,90,0,0,0,0,0; Tolerance: ±1%; Power(Watts): 100mW; Voltage-Supply(Max): 75V; Symbol: FRC0603F2701TS; Device: FRC0603F2701TS; LCSC Part Name: 2.7kΩ ±1% 100mW 厚膜电阻; SupplierPart: C2907008; ManufacturerPart: FRC0603F2701TS; Supplier Footprint: 0603; JLCPCB Part Class: Extended Part; Datasheet: https://item.szlcsc.com/datasheet/FRC0603F2701TS/3180521.html; Supplier: LCSC; ConvertToPcb: yes; FootprintName: R0603; ModelName: R0603; Type: 厚膜电阻; Value: 2.7kΩ; Temperature Coefficient: ±100ppm/℃; Operating Temperature: -55℃~+155℃
R23 R26 = FRC0603F1003TS: 电阻类型:厚膜电阻;阻值:100kΩ;精度:±1%;功率:100mW;工作电压:75V;温度系数:±100ppm/℃;; Manufacturer: FOJAN(富捷); AddInBom: yes; ModelId: fc143cca1e79419f9cd78b61e9279f08聨0819f05c4eef4c71ace90d822a990e87; ModelTransform: 31.8897,63.7794,0,90,0,0,0,0,0; Tolerance: ±1%; Power(Watts): 100mW; Voltage-Supply(Max): 75V; Symbol: FRC0603F1003TS; Device: FRC0603F1003TS; LCSC Part Name: 100kΩ ±1% 100mW 厚膜电阻; SupplierPart: C2906980; ManufacturerPart: FRC0603F1003TS; Supplier Footprint: 0603; JLCPCB Part Class: Extended Part; Datasheet: https://item.szlcsc.com/datasheet/FRC0603F1003TS/3180493.html; Supplier: LCSC; ConvertToPcb: yes; FootprintName: R0603; ModelName: R0603; Type: 厚膜电阻; Value: 100kΩ; Temperature Coefficient: ±100ppm/℃; Operating Temperature: -55℃~+155℃
R27 = FRC0603F1003TS: 电阻类型:厚膜电阻;阻值:100kΩ;精度:±1%;功率:100mW;工作电压:75V;温度系数:±100ppm/℃;; Manufacturer: FOJAN(富捷); AddInBom: yes; ModelId: fc143cca1e79419f9cd78b61e9279f08聨0819f05c4eef4c71ace90d822a990e87; ModelTransform: 31.8897,63.7794,0,90,0,0,0,0,0; Value: 100kΩ; Tolerance: ±1%; Power(Watts): 100mW; Voltage-Supply(Max): 75V; Symbol: FRC0603F1003TS; Device: FRC0603F1003TS; LCSC Part Name: 100kΩ ±1% 100mW 厚膜电阻; SupplierPart: C2906980; ManufacturerPart: FRC0603F1003TS; Supplier Footprint: 0603; JLCPCB Part Class: Extended Part; Datasheet: https://item.szlcsc.com/datasheet/FRC0603F1003TS/3180493.html; Supplier: LCSC; ConvertToPcb: yes; FootprintName: R0603; ModelName: R0603; Type: 厚膜电阻; Temperature Coefficient: ±100ppm/℃; Operating Temperature: -55℃~+155℃
R41 R52 = FRC0402P000 TS: 电阻类型:厚膜电阻;阻值:0Ω;精度:±5%;功率:62.5mW;工作电压:50V;; Manufacturer: FOJAN(富捷); AddInBom: yes; ModelId: 98c88bc2b9094f218f3a3e30a7012738聨0819f05c4eef4c71ace90d822a990e87; ModelName: R0402_L1.0-W0.5-H0.4; ModelTransform: 39.37,19.685,0,0,0,0,0,0,0; Tolerance: ±5%; Power(Watts): 62.5mW; Voltage-Supply(Max): 50V; Symbol: FRC0402P000 TS; Device: FRC0402P000 TS; LCSC Part Name: 0Ω ±5% 62.5mW 厚膜电阻; SupplierPart: C2906877; ManufacturerPart: FRC0402P000 TS; Supplier Footprint: 0402; JLCPCB Part Class: Extended Part; Datasheet: https://item.szlcsc.com/datasheet/FRC0402P000%2520TS/3180390.html; Supplier: LCSC; ConvertToPcb: yes; FootprintName: R0402; Type: 厚膜电阻; Value: 0Ω; Operating Temperature: -55℃~+155℃
R53 = FRC0402F22R0TS: 电阻类型:厚膜电阻;阻值:22Ω;精度:±1%;功率:62.5mW;工作电压:50V;温度系数:±100ppm/℃;; Manufacturer: FOJAN(富捷); AddInBom: yes; ModelId: 98c88bc2b9094f218f3a3e30a7012738聨0819f05c4eef4c71ace90d822a990e87; ModelName: R0402_L1.0-W0.5-H0.4; ModelTransform: 39.37,19.685,0,0,0,0,0,0,0; Value: 22Ω; Tolerance: ±1%; Power(Watts): 62.5mW; Voltage-Supply(Max): 50V; Symbol: FRC0402F22R0TS; Device: FRC0402F22R0TS; LCSC Part Name: 22Ω ±1% 62.5mW 厚膜电阻; SupplierPart: C2929994; ManufacturerPart: FRC0402F22R0TS; Supplier Footprint: 0402; JLCPCB Part Class: Extended Part; Datasheet: https://item.szlcsc.com/datasheet/FRC0402F22R0TS/3266927.html; Supplier: LCSC; ConvertToPcb: yes; FootprintName: R0402; Type: 厚膜电阻; Temperature Coefficient: ±100ppm/℃; Operating Temperature: -55℃~+155℃
R54 = FRC0402F0000TS: 电阻类型:厚膜电阻;阻值:0Ω;精度:±1%;功率:62.5mW;工作电压:50V;温度系数:±400ppm/℃;; Manufacturer: FOJAN(富捷); AddInBom: yes; ModelId: 98c88bc2b9094f218f3a3e30a7012738聨0819f05c4eef4c71ace90d822a990e87; ModelName: R0402_L1.0-W0.5-H0.4; ModelTransform: 39.37,19.685,0,0,0,0,0,0,0; Tolerance: ±1%; Power(Watts): 62.5mW; Voltage-Supply(Max): 50V; Symbol: FRC0402F0000TS; Device: FRC0402F0000TS; LCSC Part Name: 0Ω ±1% 62.5mW 厚膜电阻; SupplierPart: C2906858; ManufacturerPart: FRC0402F0000TS; Supplier Footprint: 0402; JLCPCB Part Class: Extended Part; Datasheet: https://item.szlcsc.com/datasheet/FRC0402F0000TS/3180371.html; Supplier: LCSC; ConvertToPcb: yes; FootprintName: R0402; Type: 厚膜电阻; Value: 0Ω; Temperature Coefficient: ±400ppm/℃; Operating Temperature: -55℃~+155℃
U1 = ISL81802FRTZ-T: 功能类型:降压型;工作电压:4.5V~80V;输出电压:800mV~76V;输出电流:-;输出类型:可调;; Manufacturer: RENESAS(瑞萨)/IDT; AddInBom: yes; ModelId: c031dd5c557943a0a1fef6f638ccfe2a聨0819f05c4eef4c71ace90d822a990e87; ModelTransform: 196.92874,196.92874,0,0,0,0,0,0,0; Function: 降压型; Frequency - Switching: 100kHz~1MHz; Synchronous Rectifier: 是; Number of Outputs: 2; Topology: 降压式; Quiescent Current: 5.5mA; Switch tube (built-in/external): 外置; Output Type: 可调; Symbol: ISL81802FRTZ-T; Device: ISL81802FRTZ-T; LCSC Part Name: 降压型 4.5V~80V; SupplierPart: C22645503; ManufacturerPart: ISL81802FRTZ-T; Supplier Footprint: TQFN-32(5x5); JLCPCB Part Class: Extended Part; Datasheet: https://item.szlcsc.com/datasheet/ISL81802FRTZ-T/24370010.html; Supplier: LCSC; ConvertToPcb: yes; FootprintName: TQFN-32_L5.0-W5.0-P0.50-TL-EP3.5; ModelName: TQFN-32_L5.0-W5.0-P0.50-TL-EP3.5; Voltage - Supply: 4.5V~80V; Output Voltage: 800mV~76V; Output Current: -; Operating Temperature: -40℃~+125℃; Features: 轻载高效模式；内置LDO稳压器；频率同步；可调软启动；过流保护；EMI优化(抖频模式)；工作状态指示；输出电压跟随
U2 U3 = XT60PB-M.G.Y: Manufacturer: AMASS(艾迈斯); AddInBom: yes; ModelId: c4c5e22dc09643cc9d2346cb05dc9304聨0819f05c4eef4c71ace90d822a990e87; ModelTransform: 629.92,318.897,0,0,0,0,0,0,-157.48; Symbol: XT60PB-M.G.Y; Device: XT60PB-M.G.Y; LCSC Part Name: AMASS(艾迈斯)插头锂电池电调航模 板立式注塑型 2PIN 接头20A双芯PCB直插金 黄 公头XT60PB-M.G.Y; SupplierPart: C19268037; ManufacturerPart: XT60PB-M.G.Y; Supplier Footprint: -; JLCPCB Part Class: Extended Part; Datasheet: https://item.szlcsc.com/datasheet/XT60PB-M.G.Y/20526048.html; Supplier: LCSC; ConvertToPcb: yes; FootprintName: CONN-TH_XT60PB-M; ModelName: CONN-TH_XT60PB-M